# Altium schematic sheet Stara wersja zasilania.SchDoc (part 2 of 3)
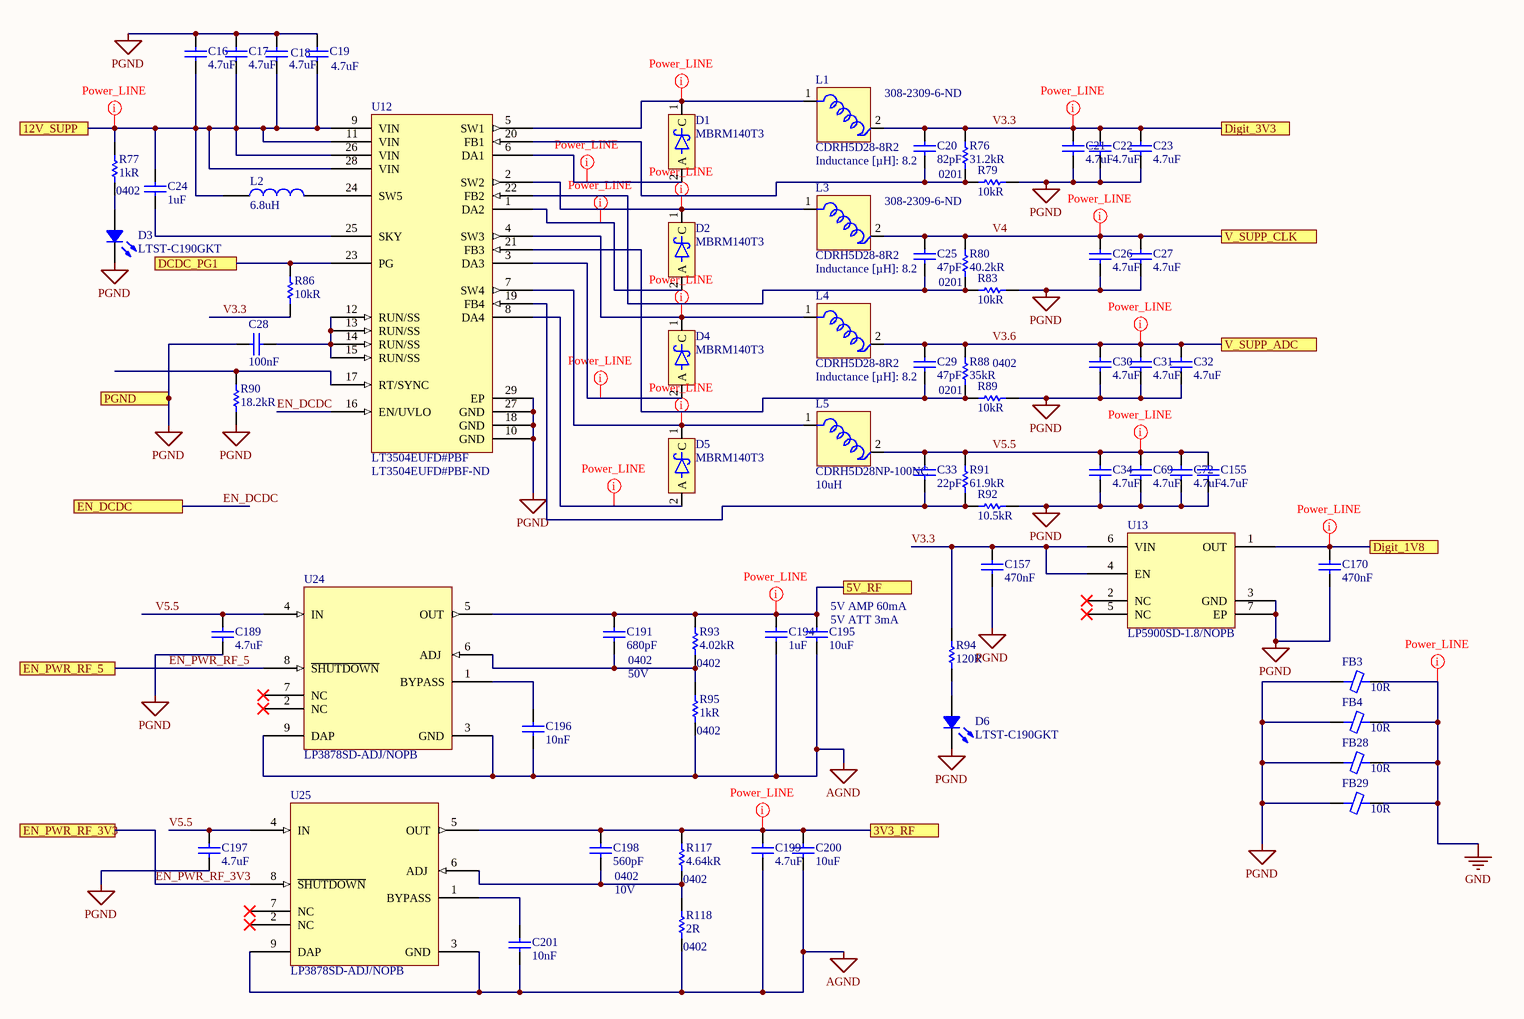
[diagram p1: Stara wersja zasilania.SchDoc]
## Library data of the parts
C16-C19 = Capacitor: Manufacturer 1: Samsung; Manufacturer Part Number 1: CL10A475KO8NNNC; Material: Ceramic; Tolerance: 10%; Voltage Rating: 16V; Dielectric: X5R; Supplier 1: Digi-Key; Supplier Part Number 1: 1276-1784-1-ND; Stock 1: 468811; Pricing 1: 1=0.26000, 10=0.17800, 100=0.10100, 500=0.07128, 1000=0.06237 (USD); RoHS: Yes; Mount: Surface Mount; Case/Package: 0603; Case Code (Metric): 1608; Case Code (Imperial): 0603; Contact Plating: Tin; Min Operating Temperature: -55°C; Max Operating Temperature: 85°C; Packaging: Tape and Reel; Package Quantity: 1; Capacitance: 4.7uF; Voltage: 16V; Length: 1.6mm; Height: 0.8mm; Width: 0.031inch; Thickness: 0.035inch; Depth: 0.8mm; Radiation Hardening: No; ComponentLink1URL: https://datasheet.ciiva.com/25795/cl10a475ko8nnnc-25795890.pdf?src-supplier=Digi-Key; ComponentLink1Description: https://datasheet.ciiva.com/25795/cl10a475ko8nnnc-25795890.pdf?src-supplier=Digi-Key; ComponentLink2URL: https://datasheet.ciiva.com/26838/getdatasheetpartid-358619-26838383.pdf?src-supplier=Verical; ComponentLink2Description: https://datasheet.ciiva.com/26838/getdatasheetpartid-358619-26838383.pdf?src-supplier=Verical; ComponentLink3URL: https://datasheet.ciiva.com/29198/457663-da-01-en-vs-kondensator-0603-29198671.pdf?src-supplier=Conrad; ComponentLink3Description: https://datasheet.ciiva.com/29198/457663-da-01-en-vs-kondensator-0603-29198671.pdf?src-supplier=Conrad
C20 = Capacitor: Multilayer Ceramic Capacitors MLCC - SMD/SMT 0201 82pF 25volts C0G +/-5%; Manufacturer: Murata; Manufacturer Part Number: GRM0335C1E820JA01D; Tolerance: 5%; Voltage Rating: 25V; Supplier 1: Digi-Key; Supplier Part Number 1: 490-11303-1-ND; RoHS: Yes; Category: Ceramic Capacitors; Stock 1: 229104; Pricing 1: 1=0,10000, 10=0,01700, 100=0,00740, 500=0,00532, 1000=0,00417, 2500=0,00380, 5000=0,00349 (USD); Mount: Surface Mount; Case Code (Imperial): 0201; Case Code (Metric): 0603; Min Operating Temperature: -55°C; Max Operating Temperature: 125°C; Dielectric: C0G; Termination: SMD/SMT; Capacitance: 82pF; Voltage Rating (DC): 25V; Packaging: Tape and Reel; Package Quantity: 15000; Length: 0.024inch; Height: 0.3mm; Thickness: 0.013inch; Width: 0.012inch; Lead Free: Lead Free; ComponentLink1URL: https://datasheet.ciiva.com/29538/grm0335c1e820ja01-01-29538864.pdf?src-supplier=Digi-Key; ComponentLink1Description: https://datasheet.ciiva.com/29538/grm0335c1e820ja01-01-29538864.pdf?src-supplier=Digi-Key
C21-C23 C26 C27 C30-C32 C199 = Capacitor: Manufacturer 1: Samsung; Manufacturer Part Number 1: CL10A475KQ8NNNC; Material: Ceramic; Tolerance: 20%; Voltage Rating: 6.3V; Dielectric: X5R; Supplier 1: Digi-Key; Supplier Part Number 1: 1276-1045-1-ND; Stock 1: 3419762; Pricing 1: 1=0.10000, 10=0.05500, 100=0.02450, 500=0.01750, 1000=0.01375 (USD); RoHS: Yes; Mount: Surface Mount; Case/Package: 0603; Case Code (Metric): 1608; Case Code (Imperial): 0603; Contact Plating: Tin; Min Operating Temperature: -55°C; Max Operating Temperature: 85°C; Capacitance: 4.7uF; Packaging: Tape and Reel; Package Quantity: 1; Voltage: 6.3V; Length: 1.6mm; Height: 0.8mm; Width: 0.031inch; Thickness: 0.035inch; Depth: 0.8mm; Radiation Hardening: No; ComponentLink1URL: https://datasheet.ciiva.com/15195/getdatasheetpartid-358620-15195714.pdf?src-supplier=Verical; ComponentLink1Description: https://datasheet.ciiva.com/15195/getdatasheetpartid-358620-15195714.pdf?src-supplier=Verical; ComponentLink2URL: https://datasheet.ciiva.com/29198/457675-da-01-en-vs-kondensator-0603-29198672.pdf?src-supplier=Conrad; ComponentLink2Description: https://datasheet.ciiva.com/29198/457675-da-01-en-vs-kondensator-0603-29198672.pdf?src-supplier=Conrad; ComponentLink3URL: https://datasheet.ciiva.com/16437/cl05b104kq5nnnc-16437321.pdf?src-supplier=Future+Electronics; ComponentLink3Description: https://datasheet.ciiva.com/16437/cl05b104kq5nnnc-16437321.pdf?src-supplier=Future+Electronics
C24 = Capacitor: Manufacturer 1: Samsung; Manufacturer Part Number 1: CL05A105MQ5NNNC; Tolerance: 20%; Voltage Rating: 6.3V; Dielectric: X5R; Supplier 1: Digi-Key; Supplier Part Number 1: 1276-1235-1-ND; Stock 1: 4412453; Pricing 1: 1=0.10000, 10=0.02600, 100=0.01160, 500=0.00832, 1000=0.00653, 2500=0.00594, 5000=0.00546 (USD); RoHS: Yes; Mount: Surface Mount; Case/Package: 0402; Case Code (Metric): 1005; Case Code (Imperial): 0402; Contact Plating: Tin; Min Operating Temperature: -55°C; Max Operating Temperature: 85°C; Package Quantity: 1; Packaging: Tape and Reel; Capacitance: 1uF; Length: 1mm; Height: 0.5mm; Width: 0.02inch; Thickness: 0.022inch; Depth: 0.5mm; Radiation Hardening: No; ComponentLink1URL: https://datasheet.ciiva.com/25802/cl05a105mq5nnnc-25802787.pdf?src-supplier=Digi-Key; ComponentLink1Description: https://datasheet.ciiva.com/25802/cl05a105mq5nnnc-25802787.pdf?src-supplier=Digi-Key; ComponentLink2URL: https://datasheet.ciiva.com/26838/getdatasheetpartid-355273-26838165.pdf?src-supplier=Verical; ComponentLink2Description: https://datasheet.ciiva.com/26838/getdatasheetpartid-355273-26838165.pdf?src-supplier=Verical; ComponentLink3URL: https://datasheet.ciiva.com/16387/cl05b104kq5nnnc-16387465.pdf?src-supplier=Future+Electronics; ComponentLink3Description: https://datasheet.ciiva.com/16387/cl05b104kq5nnnc-16387465.pdf?src-supplier=Future+Electronics
C25 C29 = Capacitor: CAP CER 47PF 25V 5% NP0 0201; Manufacturer: Murata; Manufacturer Part Number: GRM0335C1E470JA01J; Supplier 1: Digi-Key; Supplier Part Number 1: 490-14548-1-ND; RoHS: Yes; Category: Ceramic Capacitors; Stock 1: 86315; Pricing 1: 1=0,10000, 10=0,01300, 100=0,00560, 500=0,00400, 1000=0,00315, 2500=0,00286, 5000=0,00263 (USD); Mount: Surface Mount; Case Code (Imperial): 0201; Case Code (Metric): 0603; Min Operating Temperature: -55°C; Max Operating Temperature: 125°C; Voltage Rating (DC): 25V; Termination: SMD/SMT; Capacitance: 47pF; Tolerance: 5%; Packaging: Tape and Reel; Voltage Rating: 25V; Package Quantity: 50000; Length: 0.024inch; Thickness: 0.013inch; Width: 0.012inch; Lead Free: Lead Free; ComponentLink1URL: https://datasheet.ciiva.com/29535/grm0335c1e470ja01-01-29535197.pdf?src-supplier=Digi-Key; ComponentLink1Description: https://datasheet.ciiva.com/29535/grm0335c1e470ja01-01-29535197.pdf?src-supplier=Digi-Key
C28 = Capacitor: Manufacturer 1: Samsung; Manufacturer Part Number 1: CL10B104KB8NNNC; Material: Ceramic; Tolerance: 10%; Dielectric: X7R; Voltage Rating: 50V; Supplier 1: Digi-Key; Supplier Part Number 1: 1276-1000-1-ND; Stock 1: 8464769; Pricing 1: 1=0.10000, 10=0.02600, 100=0.01170, 500=0.00836, 1000=0.00657 (USD); RoHS: Yes; Mount: Surface Mount; Case/Package: 0603; Case Code (Metric): 1608; Case Code (Imperial): 0603; Contact Plating: Tin; Min Operating Temperature: -55°C; Max Operating Temperature: 125°C; Package Quantity: 1; Packaging: Tape and Reel; Capacitance: 100nF; Voltage: 50V; Voltage Rating (DC): 50V; Length: 1.6mm; Height: 0.8mm; Width: 0.031inch; Depth: 0.8mm; Thickness: 0.035inch; Radiation Hardening: No; Lead Free: Lead Free; ComponentLink1URL: https://datasheet.ciiva.com/25803/cl10b104kb8nnnc-25803393.pdf?src-supplier=Digi-Key; ComponentLink1Description: https://datasheet.ciiva.com/25803/cl10b104kb8nnnc-25803393.pdf?src-supplier=Digi-Key; ComponentLink2URL: https://datasheet.ciiva.com/26838/getdatasheetpartid-89097-26838411.pdf?src-supplier=Verical; ComponentLink2Description: https://datasheet.ciiva.com/26838/getdatasheetpartid-89097-26838411.pdf?src-supplier=Verical; ComponentLink3URL: https://datasheet.ciiva.com/29198/456651-da-01-en-vs-kondensator-0605-29198839.pdf?src-supplier=Conrad; ComponentLink3Description: https://datasheet.ciiva.com/29198/456651-da-01-en-vs-kondensator-0605-29198839.pdf?src-supplier=Conrad
C33 = Capacitor: Manufacturer 1: Samsung; Manufacturer Part Number 1: CL05C220JB5NNNC; Material: Ceramic; Tolerance: 5%; Voltage Rating: 50V; Dielectric: C0G; Temperature Coefficient: 300ppm/°C; Supplier 1: Digi-Key; Supplier Part Number 1: 1276-1116-1-ND; Stock 1: 1523204; Pricing 1: 1=0.10000, 10=0.03300, 100=0.01480, 500=0.01058, 1000=0.00831, 2500=0.00755, 5000=0.00695 (USD); RoHS: Yes; Mount: Surface Mount; Case/Package: 0402; Case Code (Metric): 1005; Case Code (Imperial): 0402; Contact Plating: Tin; Min Operating Temperature: -55°C; Max Operating Temperature: 125°C; Package Quantity: 1; Packaging: Tape and Reel; Capacitance: 22pF; Voltage: 50V; Length: 1mm; Height: 0.5mm; Width: 0.02inch; Thickness: 0.022inch; Depth: 0.5mm; Radiation Hardening: No; ComponentLink1URL: https://datasheet.ciiva.com/15195/getdatasheetpartid-358448-15195679.pdf?src-supplier=Verical; ComponentLink1Description: https://datasheet.ciiva.com/15195/getdatasheetpartid-358448-15195679.pdf?src-supplier=Verical; ComponentLink2URL: https://datasheet.ciiva.com/29198/458663-da-01-en-vs-kondensator-0402-29198414.pdf?src-supplier=Conrad; ComponentLink2Description: https://datasheet.ciiva.com/29198/458663-da-01-en-vs-kondensator-0402-29198414.pdf?src-supplier=Conrad; ComponentLink3URL: https://datasheet.ciiva.com/16199/cl05b104kq5nnnc-16199080.pdf?src-supplier=Future+Electronics; ComponentLink3Description: https://datasheet.ciiva.com/16199/cl05b104kq5nnnc-16199080.pdf?src-supplier=Future+Electronics; ComponentLink4URL: https://datasheet.ciiva.com/26309/mlcc-catalogdownload2013-eng-26309032.pdf?src-supplier=Distrelec; ComponentLink4Description: https://datasheet.ciiva.com/26309/mlcc-catalogdownload2013-eng-26309032.pdf?src-supplier=Distrelec
C34 C69 C72 C155 C189 C197 = Capacitor: Cap Ceramic 4.7uF 10V X5R 10% SMD 0603 85C T/R; Manufacturer: Taiyo Yuden; Manufacturer Part Number: LMK107BJ475KA-T; Supplier 1: Digi-Key; Supplier Part Number 1: 587-1441-1-ND; RoHS: Yes; Category: Ceramic Capacitors; Stock 1: 2822727; Pricing 1: 1=0,19000, 10=0,12700, 100=0,06440, 500=0,04408, 1000=0,03899 (USD); Mount: Surface Mount; Case/Package: 0603; Number of Pins: 2; Dielectric Material: Ceramic; Contact Plating: Nickel; Case Code (Imperial): 0603; Case Code (Metric): 1608; Min Operating Temperature: -55°C; Max Operating Temperature: 85°C; Dielectric: X5R; Voltage Rating (DC): 10V; Capacitance: 4.7uF; Tolerance: 10%; Packaging: Tape and Reel; Package Quantity: 1; Termination: SMD/SMT; Voltage Rating: 10V; Length: 1.6mm; Height: 0.8mm; Width: 0.031inch; Thickness: 0.035inch; Depth: 0.8mm; Radiation Hardening: No; Lead Free: Lead Free; Halogen Free: Halogen Free; REACH SVHC: Unknown; ComponentLink1URL: https://datasheet.ciiva.com/135/lmk107bj475ka-t-ss-135643.pdf?src-supplier=Digi-Key; ComponentLink1Description: https://datasheet.ciiva.com/135/lmk107bj475ka-t-ss-135643.pdf?src-supplier=Digi-Key; ComponentLink2URL: https://datasheet.ciiva.com/26872/getdatasheetpartid-638615-26872655.pdf?src-supplier=Verical; ComponentLink2Description: https://datasheet.ciiva.com/26872/getdatasheetpartid-638615-26872655.pdf?src-supplier=Verical; ComponentLink3URL: https://datasheet.ciiva.com/15921/344lmk107bj475ka-t-15921264.pdf?src-supplier=Onlinecomponents.com; ComponentLink3Description: https://datasheet.ciiva.com/15921/344lmk107bj475ka-t-15921264.pdf?src-supplier=Onlinecomponents.com; ComponentLink4URL: https://datasheet.ciiva.com/30054/131lmk107bj475ka-t-30054339.pdf?src-supplier=Onlinecomponents.com; ComponentLink4Description: https://datasheet.ciiva.com/30054/131lmk107bj475ka-t-30054339.pdf?src-supplier=Onlinecomponents.com; ComponentLink5URL: https://datasheet.ciiva.com/11463/lmk107bj475ka-t-ss-11463768.pdf?src-supplier=Avnet; ComponentLink5Description: https://datasheet.ciiva.com/11463/lmk107bj475ka-t-ss-11463768.pdf?src-supplier=Avnet; ComponentLink6URL: https://datasheet.ciiva.com/5424/mlcc01-e-5424565.pdf?src-supplier=Mouser; ComponentLink6Description: https://datasheet.ciiva.com/5424/mlcc01-e-5424565.pdf?src-supplier=Mouser; ComponentLink7URL: https://datasheet.ciiva.com/7975/746258-7975564.pdf?src-supplier=Element14; ComponentLink7Description: https://datasheet.ciiva.com/7975/746258-7975564.pdf?src-supplier=Element14
C157 C170 = Capacitor: Manufacturer 1: Samsung; Manufacturer Part Number 1: CL05A474KP5NNNC; Tolerance: 10%; Voltage Rating: 10V; Dielectric: X5R; Supplier 1: Digi-Key; Supplier Part Number 1: 1276-1173-1-ND; Stock 1: 1267992; Pricing 1: 1=0.10000, 10=0.07000, 100=0.03140, 500=0.02240, 1000=0.01761, 2500=0.01600, 5000=0.01472 (USD); RoHS: Yes; Mount: Surface Mount; Case/Package: 0402; Case Code (Metric): 1005; Case Code (Imperial): 0402; Min Operating Temperature: -55°C; Max Operating Temperature: 85°C; Packaging: Tape and Reel; Capacitance: 470nF; Voltage Rating (DC): 10V; Length: 1mm; Height: 0.5mm; Width: 0.02inch; Thickness: 0.022inch; Depth: 0.5mm; Radiation Hardening: No; Lead Free: Lead Free; ComponentLink1URL: https://datasheet.ciiva.com/25710/cl05a474kp5nnnc-25710324.pdf?src-supplier=Digi-Key; ComponentLink1Description: https://datasheet.ciiva.com/25710/cl05a474kp5nnnc-25710324.pdf?src-supplier=Digi-Key; ComponentLink2URL: https://datasheet.ciiva.com/26838/getdatasheetpartid-355286-26838191.pdf?src-supplier=Verical; ComponentLink2Description: https://datasheet.ciiva.com/26838/getdatasheetpartid-355286-26838191.pdf?src-supplier=Verical; ComponentLink3URL: https://datasheet.ciiva.com/16437/cl05b104kq5nnnc-16437351.pdf?src-supplier=Future+Electronics; ComponentLink3Description: https://datasheet.ciiva.com/16437/cl05b104kq5nnnc-16437351.pdf?src-supplier=Future+Electronics
C191 = Capacitor: Manufacturer 1: Samsung; Manufacturer Part Number 1: CL05B681KB5NNNC; Material: Ceramic; Tolerance: 10%; Dielectric: X7R; Supplier 1: Digi-Key; Supplier Part Number 1: 1276-1583-1-ND; Stock 1: 1154024; Pricing 1: 1=0.10000, 10=0.03200, 100=0.01420, 500=0.01012, 1000=0.00795, 2500=0.00722, 5000=0.00665 (USD); RoHS: Yes; Mount: Surface Mount; Case Code (Metric): 1005; Case Code (Imperial): 0402; Min Operating Temperature: -55°C; Max Operating Temperature: 125°C; Package Quantity: 1; Packaging: Tape and Reel; Capacitance: 680pF; Length: 1mm; Height: 0.5mm; Width: 0.02inch; Thickness: 0.022inch; Depth: 0.5mm; Radiation Hardening: No; ComponentLink1URL: https://datasheet.ciiva.com/16428/cl05b681kb5nnnc-16428786.pdf?src-supplier=Future+Electronics; ComponentLink1Description: https://datasheet.ciiva.com/16428/cl05b681kb5nnnc-16428786.pdf?src-supplier=Future+Electronics; ComponentLink2URL: https://datasheet.ciiva.com/25789/cl05b681kb5nnnc-25789493.pdf?src-supplier=Digi-Key; ComponentLink2Description: https://datasheet.ciiva.com/25789/cl05b681kb5nnnc-25789493.pdf?src-supplier=Digi-Key; ComponentLink3URL: https://datasheet.ciiva.com/29198/458344-da-01-en-vs-kondensator-0402-29198504.pdf?src-supplier=Conrad; ComponentLink3Description: https://datasheet.ciiva.com/29198/458344-da-01-en-vs-kondensator-0402-29198504.pdf?src-supplier=Conrad
C194 = Capacitor: Manufacturer 1: TDK; Manufacturer Part Number 1: C1608X7R1C105K080AC; Dielectric Material: Ceramic; Tolerance: 10%; Voltage Rating: 16V; Dielectric: X7R; Supplier 1: Digi-Key; Supplier Part Number 1: 445-1604-1-ND; Stock 1: 314791; Pricing 1: 1=0.15000, 10=0.10500, 100=0.04950, 500=0.03472, 1000=0.02875 (USD); RoHS: Yes; Mount: Surface Mount; Case/Package: 0603; Weight: 7.1E-05oz; Case Code (Metric): 1608; Case Code (Imperial): 0603; Min Operating Temperature: -55°C; Max Operating Temperature: 125°C; Packaging: Tape and Reel; Package Quantity: 1; Termination: SMD/SMT; Capacitance: 1uF; Voltage Rating (DC): 16V; Composition: Ceramic; Voltage: 16V; Length: 1.6mm; Height: 0.8mm; Width: 0.031inch; Thickness: 0.037inch; Depth: 0.8mm; Radiation Hardening: No; REACH SVHC: No SVHC; Lead Free: Lead Free; ComponentLink1URL: https://datasheet.ciiva.com/22648/1796654-22648704.pdf?src-supplier=Element14; ComponentLink1Description: https://datasheet.ciiva.com/22648/1796654-22648704.pdf?src-supplier=Element14; ComponentLink2URL: https://datasheet.ciiva.com/11788/0900766b80c1bb00-11788075.pdf?src-supplier=RSComponents; ComponentLink2Description: https://datasheet.ciiva.com/11788/0900766b80c1bb00-11788075.pdf?src-supplier=RSComponents; ComponentLink3URL: https://datasheet.ciiva.com/6250/tdkmlcccaprange-6250871.pdf?src-supplier=Digi-Key; ComponentLink3Description: https://datasheet.ciiva.com/6250/tdkmlcccaprange-6250871.pdf?src-supplier=Digi-Key; ComponentLink4URL: https://datasheet.ciiva.com/16199/e412-c-16199815.pdf?src-supplier=Future+Electronics; ComponentLink4Description: https://datasheet.ciiva.com/16199/e412-c-16199815.pdf?src-supplier=Future+Electronics; ComponentLink5URL: https://datasheet.ciiva.com/6156/1571323-6156168.pdf?src-supplier=Farnell; ComponentLink5Description: https://datasheet.ciiva.com/6156/1571323-6156168.pdf?src-supplier=Farnell; ComponentLink6URL: https://datasheet.ciiva.com/48671/e412-c-48671305.pdf?src-supplier=Avnet; ComponentLink6Description: https://datasheet.ciiva.com/48671/e412-c-48671305.pdf?src-supplier=Avnet; ComponentLink7URL: https://datasheet.ciiva.com/26285/3025c1608x7r1c105k080ac-26285242.pdf?src-supplier=Onlinecomponents.com; ComponentLink7Description: https://datasheet.ciiva.com/26285/3025c1608x7r1c105k080ac-26285242.pdf?src-supplier=Onlinecomponents.com; ComponentLink8URL: https://datasheet.ciiva.com/22749/1744655-22749595.pdf?src-supplier=Element14; ComponentLink8Description: https://datasheet.ciiva.com/22749/1744655-22749595.pdf?src-supplier=Element14; ComponentLink9URL: https://datasheet.ciiva.com/15192/getdatasheetpartid-715881-15192029.pdf?src-supplier=Verical; ComponentLink9Description: https://datasheet.ciiva.com/15192/getdatasheetpartid-715881-15192029.pdf?src-supplier=Verical; ComponentLink10URL: https://datasheet.ciiva.com/17487/e412-c-17487343.pdf?src-supplier=Avnet+Europe; ComponentLink10Description: https://datasheet.ciiva.com/17487/e412-c-17487343.pdf?src-supplier=Avnet+Europe; ComponentLink11URL: https://datasheet.ciiva.com/22694/1796654-22694127.pdf?src-supplier=Element14; ComponentLink11Description: https://datasheet.ciiva.com/22694/1796654-22694127.pdf?src-supplier=Element14
C195 C200 = Capacitor: Manufacturer 1: KEMET; Manufacturer Part Number 1: C0805C106K8PACTU; Dielectric Material: Ceramic; Tolerance: 10%; Dielectric: X5R; Voltage Rating (DC): 10V; Supplier 1: Digi-Key; Supplier Part Number 1: 399-4925-1-ND; Stock 1: 697277; Pricing 1: 1=0.16000, 10=0.11700, 100=0.05500, 500=0.03858, 1000=0.03194 (USD); RoHS: Yes; Mount: Surface Mount; Case/Package: 0805; Number of Pins: 2; Contact Plating: Tin,Matte; Case Code (Imperial): 0805; Case Code (Metric): 2012; Min Operating Temperature: -55°C; Max Operating Temperature: 85°C; Capacitance: 10uF; Packaging: Tape and Reel; Termination: SMD/SMT; Package Quantity: 1; Voltage Rating: 10V; Voltage: 10V; Dissipation Factor: 10%; Length: 2mm; Height: 1.25mm; Depth: 1.25mm; Width: 1.2mm; Thickness: 0.055inch; Radiation Hardening: No; REACH SVHC: No SVHC; ComponentLink1URL: https://datasheet.ciiva.com/7842/1732709-7842198.pdf?src-supplier=Element14; ComponentLink1Description: https://datasheet.ciiva.com/7842/1732709-7842198.pdf?src-supplier=Element14; ComponentLink2URL: https://datasheet.ciiva.com/22704/1732709-22704859.pdf?src-supplier=Element14; ComponentLink2Description: https://datasheet.ciiva.com/22704/1732709-22704859.pdf?src-supplier=Element14
C196 C201 = Capacitor: Manufacturer 1: Murata; Manufacturer Part Number 1: GRM1885C1H103JA01D; Material: Ceramic; Voltage Rating: 50V; Tolerance: 5%; Dielectric: C0G; Supplier 1: Digi-Key; Supplier Part Number 1: 490-9666-1-ND; Stock 1: 1084376; Pricing 1: 1=0.20000, 10=0.13500, 100=0.06820, 500=0.04664, 1000=0.04126 (USD); RoHS: Yes; Mount: Surface Mount; Case/Package: 0603; Case Code (Metric): 1608; Case Code (Imperial): 0603; Min Operating Temperature: -55°C; Max Operating Temperature: 125°C; Packaging: Tape and Reel; Package Quantity: 4000; Capacitance: 10nF; Voltage Rating (DC): 50V; Termination: SMD/SMT; Voltage: 50V; Length: 1.6mm; Height: 0.8mm; Width: 0.8mm; Thickness: 0.035inch; Lead Pitch: 0.5mm; Depth: 0.8mm; REACH SVHC: No SVHC; Lead Free: Lead Free; ComponentLink1URL: https://datasheet.ciiva.com/29537/partnumbering-e-01-29537910.pdf?src-supplier=Digi-Key; ComponentLink1Description: https://datasheet.ciiva.com/29537/partnumbering-e-01-29537910.pdf?src-supplier=Digi-Key; ComponentLink2URL: https://datasheet.ciiva.com/41860/partnumbering-e-01-41860759.pdf?src-supplier=Digi-Key; ComponentLink2Description: https://datasheet.ciiva.com/41860/partnumbering-e-01-41860759.pdf?src-supplier=Digi-Key
C198 = Capacitor: CAP CER 560PF 10V X7R 0402; Manufacturer: Kyocera AVX; Manufacturer Part Number: 0402ZC561KAT2A; Tolerance: 10%; Supplier 1: Digi-Key; Supplier Part Number 1: 478-11791-1-ND; RoHS: Yes; Category: Ceramic Capacitors; Stock 1: 5031; Pricing 1: 1=0,33000, 10=0,22800, 100=0,12900, 500=0,09108, 1000=0,07970, 2500=0,07590, 5000=0,07021 (USD); Mount: Surface Mount; Case Code (Imperial): 0402; Case Code (Metric): 1005; Min Operating Temperature: -55°C; Max Operating Temperature: 125°C; Capacitance: 560pF; Package Quantity: 10000; Voltage Rating (DC): 10V; Packaging: Tape and Reel; Termination: SMD/SMT; Dielectric: X7R; Length: 1mm; Width: 0.5mm; Thickness: 0.022inch; Depth: 0.5mm; Radiation Hardening: No; Lead Free: Lead Free; ComponentLink1URL: https://datasheet.ciiva.com/6269/cx7r-6269704.pdf?src-supplier=Digi-Key; ComponentLink1Description: https://datasheet.ciiva.com/6269/cx7r-6269704.pdf?src-supplier=Digi-Key
D1 D2 D4 D5 = MBRM140T1G: Supplier Part Number 1: MBRM140T3GOSCT-ND; Supplier 1: Digi-Key
D3 D6 = LTST-C190GKT: LED,  LTST-C190GKT; Manufacturer 1: Vishay Lite-On; Color: Green; Lens Color: Colorless; Luminous Intensity: 6mcd; Forward Voltage: 2.1V; Viewing Angle: 130°; Lens Style: Clear,Diffused,Colorless,Rectangular; Forward Current: 30mA; Power Rating: 100mW; Dominant Wavelength: 569nm; Test Current: 10mA; Lens Transparency: Clear; Number of Elements: 1; Wavelength: 565nm; Voltage: 2V; Reverse Voltage: 5V; Supplier 1: Digi-Key; Manufacturer Part Number 1: LTST-C190GKT; Stock 1: 908158; Pricing 1: 1=0.26000, 10=0.18800, 100=0.08880, 500=0.05922, 1000=0.04639 (USD); RoHS: Yes; Mount: Surface Mount; Case/Package: 0603; Number of Pins: 2; Case Code (Metric): 1608; Case Code (Imperial): 0603; Min Operating Temperature: -55°C; Max Operating Temperature: 85°C; Package Quantity: 1; Packaging: Tape and Reel; Illumination Color: Green; Power Dissipation: 100mW; Number of LEDs: 1; Length: 1.6mm; Height: 0.8mm; Width: 0.8mm; Depth: 0.8mm; Radiation Hardening: No; Lead Free: Lead Free; ComponentLink1URL: https://datasheet.ciiva.com/11775/0900766b80dc02a6-11775616.pdf?src-supplier=RSComponents; ComponentLink1Description: https://datasheet.ciiva.com/11775/0900766b80dc02a6-11775616.pdf?src-supplier=RSComponents; ComponentLink2URL: https://datasheet.ciiva.com/2109/ltst-c190gkt-2109985.pdf?src-supplier=Digi-Key; ComponentLink2Description: https://datasheet.ciiva.com/2109/ltst-c190gkt-2109985.pdf?src-supplier=Digi-Key; ComponentLink3URL: https://datasheet.ciiva.com/16392/lite-on20ltst-c190gkt-16392818.pdf?src-supplier=Future+Electronics; ComponentLink3Description: https://datasheet.ciiva.com/16392/lite-on20ltst-c190gkt-16392818.pdf?src-supplier=Future+Electronics; ComponentLink4URL: https://datasheet.ciiva.com/12403/lite-on-ltst-c190gkt-187204-12403884.pdf?src-supplier=Mouser; ComponentLink4Description: https://datasheet.ciiva.com/12403/lite-on-ltst-c190gkt-187204-12403884.pdf?src-supplier=Mouser; ComponentLink5URL: https://datasheet.ciiva.com/2109/ltst-c190gkt-2109986.pdf?src-supplier=Digi-Key; ComponentLink5Description: https://datasheet.ciiva.com/2109/ltst-c190gkt-2109986.pdf?src-supplier=Digi-Key; ComponentLink6URL: https://datasheet.ciiva.com/2109/ltst-c190gkt-2109987.pdf?src-supplier=Digi-Key; ComponentLink6Description: https://datasheet.ciiva.com/2109/ltst-c190gkt-2109987.pdf?src-supplier=Digi-Key; Supplier Part Number 1: 160-1183-1-ND
FB3 FB4 FB28 FB29 = Ferrite: Manufacturer 1: Murata; Manufacturer Part Number 1: BLM15AX100SN1D; Material: Ferrite,Steel; Tolerance: 25%; Current Rating: 1.74A; Number of Lines: 1; DC Resistance (DCR): 15mR; Test Frequency: 100MHz; Supplier 1: Digi-Key; Supplier Part Number 1: 490-5437-1-ND; Stock 1: 154406; Pricing 1: 1=0.11000, 10=0.09000, 25=0.08120, 50=0.05960, 100=0.05140, 250=0.04060, 500=0.03428, 1000=0.02886, 5000=0.02571 (USD); RoHS: Yes; Case/Package: 0402; Number of Pins: 2; Case Code (Metric): 1005; Case Code (Imperial): 0402; Min Operating Temperature: -55°C; Max Operating Temperature: 125°C; Package Quantity: 1; Packaging: Tape and Reel; Impedance: 10R; Max Current Rating: 1.74A; Max DC Current: 1.74A; Termination: SMD/SMT; Number of Circuits: 1; Length: 1mm; Height: 0.5mm; Width: 0.5mm; Depth: 0.5mm; REACH SVHC: No SVHC; Lead Free: Lead Free; ComponentLink1URL: https://datasheet.ciiva.com/41449/001172165-da-01-en-drossel-0402-10r0-1-0x0-5mm-10000st-41449453.pdf?src-supplier=Conrad; ComponentLink1Description: https://datasheet.ciiva.com/41449/001172165-da-01-en-drossel-0402-10r0-1-0x0-5mm-10000st-41449453.pdf?src-supplier=Conrad; ComponentLink2URL: https://datasheet.ciiva.com/1012/l0110e-1012384.pdf?src-supplier=Digi-Key; ComponentLink2Description: https://datasheet.ciiva.com/1012/l0110e-1012384.pdf?src-supplier=Digi-Key; ComponentLink3URL: https://datasheet.ciiva.com/1012/l0110e-1012385.pdf?src-supplier=Digi-Key; ComponentLink3Description: https://datasheet.ciiva.com/1012/l0110e-1012385.pdf?src-supplier=Digi-Key; ComponentLink4URL: https://datasheet.ciiva.com/1012/l0110e-1012383.pdf?src-supplier=Digi-Key; ComponentLink4Description: https://datasheet.ciiva.com/1012/l0110e-1012383.pdf?src-supplier=Digi-Key
L1 L3 L4 = CDRH5D28-8R2: Part Number: CDRH5D28NP-8R2; Supplier 2: Digi-Key
  L4: Supplier Part Number 2: 308-2309-6-ND
L2 = Inductor: Fixed Inductors 6.8uH; Manufacturer: TDK; Manufacturer Part Number: GLFR1608T6R8M-LR; DC Resistance (DCR): 350mR; Max DC Current: 400mA; Test Frequency: 7.96MHz; Current Rating: 135mA; Tolerance: 20%; Shielding: Shielded; Supplier 1: Digi-Key; Supplier Part Number 1: 445-6156-1-ND; RoHS: Yes; Category: Fixed Inductors; Stock 1: 6812; Pricing 1: 1=0,27000, 10=0,24400, 100=0,16760, 500=0,14324, 1000=0,10971 (USD); Mount: Surface Mount; Case/Package: 0603; Case Code (Metric): 1608; Case Code (Imperial): 0603; Min Operating Temperature: -40°C; Max Operating Temperature: 105°C; Inductance: 6.8uH; Termination: SMD/SMT; DC Current: 400mA; Military Standard: Not; Package Quantity: 4000; Saturation Current: 135mA; Packaging: Tape and Reel; Length: 0.063inch; Height: 0.031inch; Depth: 1mm; Width: 0.031inch; Lead Free: Lead Free; ComponentLink1URL: https://datasheet.ciiva.com/1040/glfrseries-1040833.pdf?src-supplier=Digi-Key; ComponentLink1Description: https://datasheet.ciiva.com/1040/glfrseries-1040833.pdf?src-supplier=Digi-Key; ComponentLink2URL: https://datasheet.ciiva.com/1040/glfrseries-1040834.pdf?src-supplier=Digi-Key; ComponentLink2Description: https://datasheet.ciiva.com/1040/glfrseries-1040834.pdf?src-supplier=Digi-Key; ComponentLink3URL: https://datasheet.ciiva.com/1040/glfrseries-1040835.pdf?src-supplier=Digi-Key; ComponentLink3Description: https://datasheet.ciiva.com/1040/glfrseries-1040835.pdf?src-supplier=Digi-Key
L5 = CDRH5D28NP-100NC: Inductor Power Shielded Drum Core 10uH 30% 100KHz Ferrite 1.3A 65mOhm DCR T/R; Manufacturer: Sumida; DC Resistance (DCR): 65mR; Supplier 1: Mouser; Manufacturer Part Number: CDRH5D28NP-100NC; RoHS: Yes; Category: Fixed Inductors; Stock 1: 3724; Pricing 1: 1=0,68000, 10=0,52000, 100=0,40200, 1000=0,28900, 2000=0,26300, 10000=0,25500, 24000=0,24600, 50000=0,23800, 100000=0,22600 (USD); Mount: Surface Mount; Case/Package: Nonstandard; Core Material: Ferrite; Min Operating Temperature: -40°C; Max Operating Temperature: 100°C; Tolerance: 30%; Shielding: Shielded; Packaging: Tape and Reel; Package Quantity: 1; Current Rating: 1.3A; Max DC Current: 1.3A; Termination: SMD/SMT; Test Frequency: 100kHz; DC Current: 1.3A; Military Standard: Not; Length: 6mm; Height: 3mm; Width: 6mm; Height - Seated (Max): 0.118inch; Depth: 6mm; Radiation Hardening: No; Lead Free: Lead Free; ComponentLink1URL: https://datasheet.ciiva.com/26793/cdrh5d28np-100nc-26793522.pdf?src-supplier=IIIC; ComponentLink1Description: https://datasheet.ciiva.com/26793/cdrh5d28np-100nc-26793522.pdf?src-supplier=IIIC; Supplier Part Number 1: 851-CDRH5D28NP-100NC
R76 = Resistor: Thin Film Resistors 31.2kOhm,0402,0.5%,2 5ppm,63mW,50V; Manufacturer: KOA Speer; Manufacturer Part Number: RN73H1ETTP3122D25; Temperature Coefficient: 25ppm/°C; Supplier 1: Digi-Key; Supplier Part Number 1: 2019-RN73H1ETTP3122D25CT-ND; RoHS: No; Category: Resistors; Stock 1: 14565; Pricing 1: 1=0,49000, 10=0,37200, 100=0,15630, 1000=0,08624, 2500=0,08085, 5000=0,07330 (USD); Case/Package: 0402; Weight: 2.3E-05oz; Case Code (Imperial): 0402; Case Code (Metric): 1005; Min Operating Temperature: -55°C; Max Operating Temperature: 155°C; Termination: SMD/SMT; Composition: Metal Film; Voltage Rating (DC): 50V; Resistance: 31.2kR; Power Rating: 63mW; Packaging: Tape and Reel; Tolerance: 0.5%; Voltage Rating: 50V; Length: 1mm; Height: 0.35mm; Width: 0.5mm; ComponentLink1URL: http://www.mouser.com/ds/2/219/RN73H-12200.pdf?src-supplier=Mouser; ComponentLink1Description: http://www.mouser.com/ds/2/219/RN73H-12200.pdf?src-supplier=Mouser
R77 R95 = Resistor: Manufacturer 1: Susumu; Manufacturer Part Number 1: RR0510P-102-D; Power Rating: 63mW; Tolerance: 0.5%; Voltage Rating: 25V; Temperature Coefficient: 25ppm/°C; Supplier 1: Digi-Key; Supplier Part Number 1: RR05P1.0KDCT-ND; Stock 1: 1157935; Pricing 1: 1=0.10000, 10=0.07400, 100=0.02850, 1000=0.01254, 2500=0.01083, 5000=0.00969 (USD); RoHS: Yes; Number of Pins: 2; Case Code (Metric): 1005; Case Code (Imperial): 0402; Min Operating Temperature: -55°C; Max Operating Temperature: 125°C; Package Quantity: 1; Resistance: 1kR; Packaging: Tape and Reel; Composition: Thin Film; Number of Terminations: 2; Termination: SMD/SMT; Max Power Dissipation: 63mW; Voltage Rating (DC): 25V; Length: 0.039inch; Height: 0.016inch; Width: 0.02inch; REACH SVHC: Unknown; Lead Free: Lead Free; ComponentLink1URL: https://datasheet.ciiva.com/2486/rr-data-sheet-2486776.pdf?src-supplier=Digi-Key; ComponentLink1Description: https://datasheet.ciiva.com/2486/rr-data-sheet-2486776.pdf?src-supplier=Digi-Key; ComponentLink2URL: https://datasheet.ciiva.com/2486/rr-data-sheet-2486777.pdf?src-supplier=Digi-Key; ComponentLink2Description: https://datasheet.ciiva.com/2486/rr-data-sheet-2486777.pdf?src-supplier=Digi-Key; ComponentLink3URL: https://datasheet.ciiva.com/2486/rr-data-sheet-2486778.pdf?src-supplier=Digi-Key; ComponentLink3Description: https://datasheet.ciiva.com/2486/rr-data-sheet-2486778.pdf?src-supplier=Digi-Key; ComponentLink4URL: https://datasheet.ciiva.com/7984/1581132-7984302.pdf?src-supplier=Element14; ComponentLink4Description: https://datasheet.ciiva.com/7984/1581132-7984302.pdf?src-supplier=Element14
R79 R83 R86 R89 = Resistor: Manufacturer 1: Vishay; Manufacturer Part Number 1: CRCW0402-10K0FKED; Tolerance: 1%; Power Rating: 63mW; Voltage Rating: 50V; Temperature Coefficient: 100ppm/°C; Supplier 1: Newark; Supplier Part Number 1: 52K6595; Stock 1: 0; RoHS: Yes; Mount: Surface Mount; Case/Package: 0402; Number of Pins: 2; Weight: 2.3E-05oz; Case Code (Metric): 1005; Case Code (Imperial): 0402; Contact Plating: Tin; Min Operating Temperature: -55°C; Max Operating Temperature: 155°C; Resistance: 10kR; Package Quantity: 10; Packaging: Tape and Reel; Termination: SMD/SMT; Military Standard: Not; Composition: Thick Film; Voltage Rating (DC): 50V; Number of Terminations: 2; Max Power Dissipation: 63mW; Features: Automotive AEC-Q200; Length: 1mm; Height: 0.35mm; Depth: 0.5mm; Width: 0.02inch; Radiation Hardening: No; REACH SVHC: Unknown; Lead Free: Lead Free; ComponentLink1URL: https://datasheet.ciiva.com/11809/0900766b80d98824-11809984.pdf?src-supplier=RSComponents; ComponentLink1Description: https://datasheet.ciiva.com/11809/0900766b80d98824-11809984.pdf?src-supplier=RSComponents; ComponentLink2URL: https://datasheet.ciiva.com/2463/dcrcwe3-2463025.pdf?src-supplier=Digi-Key; ComponentLink2Description: https://datasheet.ciiva.com/2463/dcrcwe3-2463025.pdf?src-supplier=Digi-Key; ComponentLink3URL: https://datasheet.ciiva.com/2463/dcrcwe3-2463026.pdf?src-supplier=Digi-Key; ComponentLink3Description: https://datasheet.ciiva.com/2463/dcrcwe3-2463026.pdf?src-supplier=Digi-Key; ComponentLink4URL: https://datasheet.ciiva.com/2463/dcrcwe3-2463027.pdf?src-supplier=Digi-Key; ComponentLink4Description: https://datasheet.ciiva.com/2463/dcrcwe3-2463027.pdf?src-supplier=Digi-Key; ComponentLink5URL: https://datasheet.ciiva.com/46385/1697337-46385560.pdf?src-supplier=Element14; ComponentLink5Description: https://datasheet.ciiva.com/46385/1697337-46385560.pdf?src-supplier=Element14; ComponentLink6URL: https://datasheet.ciiva.com/3255/dcrcwe3-3255961.pdf?src-supplier=Avnet; ComponentLink6Description: https://datasheet.ciiva.com/3255/dcrcwe3-3255961.pdf?src-supplier=Avnet; ComponentLink7URL: https://datasheet.ciiva.com/3255/dcrcwe3-3255962.pdf?src-supplier=Avnet; ComponentLink7Description: https://datasheet.ciiva.com/3255/dcrcwe3-3255962.pdf?src-supplier=Avnet; ComponentLink8URL: https://datasheet.ciiva.com/5547/dcrcwe3-109170-5547786.pdf?src-supplier=Mouser; ComponentLink8Description: https://datasheet.ciiva.com/5547/dcrcwe3-109170-5547786.pdf?src-supplier=Mouser; ComponentLink9URL: https://datasheet.ciiva.com/26316/fld-crcw-e3-data-en-26316618.pdf?src-supplier=Distrelec; ComponentLink9Description: https://datasheet.ciiva.com/26316/fld-crcw-e3-data-en-26316618.pdf?src-supplier=Distrelec; ComponentLink10URL: https://datasheet.ciiva.com/16208/dcrcwe3-16208525.pdf?src-supplier=Future+Electronics; ComponentLink10Description: https://datasheet.ciiva.com/16208/dcrcwe3-16208525.pdf?src-supplier=Future+Electronics; ComponentLink11URL: https://datasheet.ciiva.com/36856/1720486-36856909.pdf?src-supplier=Element14; ComponentLink11Description: https://datasheet.ciiva.com/36856/1720486-36856909.pdf?src-supplier=Element14
R80 = Resistor: RES 40.2K OHM 1% 1/16W 0402; Manufacturer: Stackpole Electronics; Manufacturer Part Number: RMCF0402FT40K2; Max Power Dissipation: 63mW; Temperature Coefficient: 100ppm/°C; Supplier 1: Digi-Key; Supplier Part Number 1: RMCF0402FT40K2CT-ND; RoHS: Yes; Category: Chip SMD Resistors; Stock 1: 48331; Pricing 1: 1=0,10000, 10=0,01400, 100=0,00580, 1000=0,00262, 2500=0,00228, 5000=0,00188 (USD); Mount: Surface Mount; Case/Package: 0402; Contact Plating: Tin,Matte; Case Code (Imperial): 0402; Case Code (Metric): 1005; Min Operating Temperature: -55°C; Max Operating Temperature: 155°C; Resistance: 40.2kR; Tolerance: 1%; Packaging: Tape and Reel; Composition: Thick Film; Number of Terminations: 2; Features: Automotive AEC-Q200; Length: 0.039inch; Height: 0.016inch; Width: 0.02inch; Radiation Hardening: No; Lead Free: Lead Free; ComponentLink1URL: https://www.seielect.com/catalog/SEI-Packaging.pdf?src-supplier=Digi-Key; ComponentLink1Description: https://www.seielect.com/catalog/SEI-Packaging.pdf?src-supplier=Digi-Key; ComponentLink2URL: https://www.seielect.com/catalog/SEI-RMCF_RMCP.pdf?src-supplier=Avnet; ComponentLink2Description: https://www.seielect.com/catalog/SEI-RMCF_RMCP.pdf?src-supplier=Avnet; ComponentLink3URL: http://components.arrow.com/part/dataview/50863704S9798453N1174?src-supplier=Arrow; ComponentLink3Description: http://components.arrow.com/part/dataview/50863704S9798453N1174?src-supplier=Arrow
R88 = Resistor: RES SMD 35K OHM 0.1% 1/20W 0402; Manufacturer: Vishay Dale; Manufacturer Part Number: PNM0402E3502BST1; Max Power Dissipation: 50mW; Temperature Coefficient: 25ppm/°C; Supplier 1: Digi-Key; Supplier Part Number 1: 541-1904-1-ND; RoHS: Yes; Category: Chip SMD Resistors; Stock 1: 10611; Pricing 1: 1=1,08000, 10=0,95500, 100=0,69300 (USD); Case Code (Imperial): 0402; Case Code (Metric): 1005; Min Operating Temperature: -55°C; Max Operating Temperature: 155°C; Number of Terminations: 2; Composition: Thin Film; Package Quantity: 1000; Packaging: Tape and Reel; Resistance: 35kR; Tolerance: 0.1%; Features: Moisture Resistant,Anti-Sulfur; Length: 0.042inch; Height: 0.033inch; Width: 0.022inch; ComponentLink1URL: https://datasheet.ciiva.com/29717/pnm-29717422.pdf?src-supplier=Digi-Key; ComponentLink1Description: https://datasheet.ciiva.com/29717/pnm-29717422.pdf?src-supplier=Digi-Key; ComponentLink2URL: https://datasheet.ciiva.com/29717/pnm-29717423.pdf?src-supplier=Digi-Key; ComponentLink2Description: https://datasheet.ciiva.com/29717/pnm-29717423.pdf?src-supplier=Digi-Key
R90 = Resistor: Manufacturer 1: Susumu; Manufacturer Part Number 1: RR0510P-1822-D; Power Rating: 62.5mW; Tolerance: 0.5%; Voltage Rating: 25V; Max Power Dissipation: 63mW; Temperature Coefficient: 25ppm/°C; Voltage Rating (DC): 50V; Supplier 1: Digi-Key; Supplier Part Number 1: RR05P18.2KDCT-ND; Stock 1: 48500; Pricing 1: 1=0.10000, 10=0.07400, 100=0.02850, 1000=0.01254, 2500=0.01083, 5000=0.00969 (USD); RoHS: Yes; Case/Package: 0402; Case Code (Metric): 1005; Case Code (Imperial): 0402; Min Operating Temperature: -55°C; Max Operating Temperature: 125°C; Package Quantity: 1; Resistance: 18.2kR; Packaging: Tape and Reel; Composition: Thin Film; Number of Terminations: 2; Termination: SMD/SMT; Length: 0.039inch; Height: 0.016inch; Width: 0.02inch; Lead Free: Lead Free; ComponentLink1URL: https://datasheet.ciiva.com/2494/rr-data-sheet-2494006.pdf?src-supplier=Digi-Key; ComponentLink1Description: https://datasheet.ciiva.com/2494/rr-data-sheet-2494006.pdf?src-supplier=Digi-Key; ComponentLink2URL: https://datasheet.ciiva.com/2494/rr-data-sheet-2494007.pdf?src-supplier=Digi-Key; ComponentLink2Description: https://datasheet.ciiva.com/2494/rr-data-sheet-2494007.pdf?src-supplier=Digi-Key; ComponentLink3URL: https://datasheet.ciiva.com/2494/rr-data-sheet-2494008.pdf?src-supplier=Digi-Key; ComponentLink3Description: https://datasheet.ciiva.com/2494/rr-data-sheet-2494008.pdf?src-supplier=Digi-Key
R91 = Resistor: Manufacturer 1: Panasonic; Manufacturer Part Number 1: ERA-2AEB6192X; Voltage Rating: 25V; Power Rating: 63mW; Tolerance: 0.1%; Temperature Coefficient: 25ppm/°C; Voltage Rating (DC): 50V; Supplier 1: Digi-Key; Supplier Part Number 1: P61.9KDCCT-ND; Stock 1: 12743; Pricing 1: 1=0.45000, 10=0.32100, 100=0.12830, 1000=0.06322, 2500=0.05858, 5000=0.05300 (USD); RoHS: Yes; Mount: Surface Mount; Case/Package: 0402; Case Code (Metric): 1005; Case Code (Imperial): 0402; Contact Plating: Tin; Min Operating Temperature: -55°C; Max Operating Temperature: 155°C; Packaging: Tape and Reel; Package Quantity: 1; Resistance: 61.9kR; Composition: Thin Film,Metal Film; Number of Terminations: 2; Termination: SMD/SMT; Max Power Dissipation: 63mW; Features: Automotive AEC-Q200; Length: 0.039inch; Height: 0.016inch; Width: 0.02inch; Radiation Hardening: No; REACH SVHC: Unknown; Lead Free: Lead Free; ComponentLink1URL: https://datasheet.ciiva.com/24058/aoa0000ce26-32660-24058744.pdf?src-supplier=Mouser; ComponentLink1Description: https://datasheet.ciiva.com/24058/aoa0000ce26-32660-24058744.pdf?src-supplier=Mouser
R92 = Resistor: Manufacturer 1: Panasonic; Manufacturer Part Number 1: ERA-2AEB1052X; Power Rating: 63mW; Tolerance: 0.1%; Voltage Rating: 25V; Temperature Coefficient: 25ppm/°C; Voltage Rating (DC): 50V; Supplier 1: Digi-Key; Supplier Part Number 1: P10.5KDCCT-ND; Stock 1: 29203; Pricing 1: 1=0.45000, 10=0.32100, 100=0.12830, 1000=0.06322, 2500=0.05858, 5000=0.05300 (USD); RoHS: Yes; Mount: Surface Mount; Case/Package: 0402; Case Code (Metric): 1005; Case Code (Imperial): 0402; Min Operating Temperature: -55°C; Max Operating Temperature: 155°C; Packaging: Tape and Reel; Resistance: 10.5kR; Package Quantity: 1; Composition: Metal Film,Thin Film; Number of Terminations: 2; Max Power Dissipation: 63mW; Features: Automotive AEC-Q200; Termination: SMD/SMT; Length: 0.039inch; Height: 0.016inch; Width: 0.5mm; Lead Free: Lead Free; ComponentLink1URL: http://www.mouser.com/ds/2/315/AOA0000CE26-32660.pdf?src-supplier=Mouser; ComponentLink1Description: http://www.mouser.com/ds/2/315/AOA0000CE26-32660.pdf?src-supplier=Mouser; ComponentLink2URL: https://media.digikey.com/pdf/Data%20Sheets/Panasonic%20Resistors%20Thermistors%20PDFs/ERA_Series_LE.pdf?src-supplier=Digi-Key; ComponentLink2Description: https://media.digikey.com/pdf/Data%20Sheets/Panasonic%20Resistors%20Thermistors%20PDFs/ERA_Series_LE.pdf?src-supplier=Digi-Key; ComponentLink3URL: http://www.onlinecomponents.com/datasheet/era-2aeb1052x.aspx?p=44473930&src-supplier=Onlinecomponents.com; ComponentLink3Description: http://www.onlinecomponents.com/datasheet/era-2aeb1052x.aspx?p=44473930&src-supplier=Onlinecomponents.com; ComponentLink4URL: http://www.farnell.com/datasheets/2052875.pdf?src-supplier=Newark; ComponentLink4Description: http://www.farnell.com/datasheets/2052875.pdf?src-supplier=Newark; ComponentLink5URL: https://industrial.panasonic.com/cdbs/www-data/pdf/RDM0000/AOA0000C307.pdf?src-supplier=Digi-Key; ComponentLink5Description: https://industrial.panasonic.com/cdbs/www-data/pdf/RDM0000/AOA0000C307.pdf?src-supplier=Digi-Key
R93 = Resistor: Manufacturer 1: Susumu; Manufacturer Part Number 1: RR0510P-4021-D; Power Rating: 62.5mW; Tolerance: 0.5%; Voltage Rating: 25V; Temperature Coefficient: 25ppm/°C; Max Power Dissipation: 63mW; Voltage Rating (DC): 50V; Supplier 1: Digi-Key; Supplier Part Number 1: RR05P4.02KDCT-ND; Stock 1: 40212; Pricing 1: 1=0.10000, 10=0.07400, 100=0.02850, 1000=0.01254, 2500=0.01083, 5000=0.00969 (USD); RoHS: Yes; Case Code (Metric): 1005; Case Code (Imperial): 0402; Min Operating Temperature: -55°C; Max Operating Temperature: 125°C; Package Quantity: 10000; Resistance: 4.02kR; Packaging: Tape and Reel; Composition: Thin Film; Number of Terminations: 2; Termination: SMD/SMT; Length: 0.039inch; Height: 0.016inch; Width: 0.02inch; Lead Free: Lead Free; ComponentLink1URL: https://datasheet.ciiva.com/2494/rr-data-sheet-2494048.pdf?src-supplier=Digi-Key; ComponentLink1Description: https://datasheet.ciiva.com/2494/rr-data-sheet-2494048.pdf?src-supplier=Digi-Key; ComponentLink2URL: https://datasheet.ciiva.com/2494/rr-data-sheet-2494049.pdf?src-supplier=Digi-Key; ComponentLink2Description: https://datasheet.ciiva.com/2494/rr-data-sheet-2494049.pdf?src-supplier=Digi-Key; ComponentLink3URL: https://datasheet.ciiva.com/2494/rr-data-sheet-2494050.pdf?src-supplier=Digi-Key; ComponentLink3Description: https://datasheet.ciiva.com/2494/rr-data-sheet-2494050.pdf?src-supplier=Digi-Key
R94 = Resistor: Manufacturer 1: Vishay; Manufacturer Part Number 1: CRCW0402120RFKED; Tolerance: 1%; Voltage Rating: 50V; Temperature Coefficient: 100ppm/°C; Power Rating: 63mW; Supplier 1: Digi-Key; Supplier Part Number 1: 541-120LCT-ND; Stock 1: 158664; Pricing 1: 1=0,10000, 10=0,03800, 100=0,01540, 1000=0,00690, 2500=0,00599, 5000=0,00495 (USD); RoHS: Yes; Mount: Surface Mount; Case/Package: 0402; Weight: 2.3E-05oz; Case Code (Metric): 1005; Case Code (Imperial): 0402; Contact Plating: Tin; Min Operating Temperature: -55°C; Max Operating Temperature: 155°C; Packaging: Tape and Reel; Package Quantity: 10000; Termination: SMD/SMT; Composition: Thick Film; Resistance: 120R; Voltage Rating (DC): 50V; Military Standard: Not; Number of Terminations: 2; Max Power Dissipation: 63mW; Features: Automotive AEC-Q200; Working Voltage: 50V; Length: 1mm; Height: 0.35mm; Width: 0.02inch; Depth: 0.5mm; Radiation Hardening: No; REACH SVHC: Unknown; Lead Free: Lead Free; ComponentLink1URL: https://datasheet.ciiva.com/11817/0900766b80d98824-11817989.pdf?src-supplier=RSComponents; ComponentLink1Description: https://datasheet.ciiva.com/11817/0900766b80d98824-11817989.pdf?src-supplier=RSComponents; ComponentLink2URL: https://datasheet.ciiva.com/2463/dcrcwe3-2463109.pdf?src-supplier=Digi-Key; ComponentLink2Description: https://datasheet.ciiva.com/2463/dcrcwe3-2463109.pdf?src-supplier=Digi-Key; ComponentLink3URL: https://datasheet.ciiva.com/8336/dcrcwe3-8336661.pdf?src-supplier=Avnet; ComponentLink3Description: https://datasheet.ciiva.com/8336/dcrcwe3-8336661.pdf?src-supplier=Avnet; ComponentLink4URL: https://datasheet.ciiva.com/2463/dcrcwe3-2463110.pdf?src-supplier=Digi-Key; ComponentLink4Description: https://datasheet.ciiva.com/2463/dcrcwe3-2463110.pdf?src-supplier=Digi-Key; ComponentLink5URL: https://datasheet.ciiva.com/5550/dcrcwe3-109170-5550502.pdf?src-supplier=Mouser; ComponentLink5Description: https://datasheet.ciiva.com/5550/dcrcwe3-109170-5550502.pdf?src-supplier=Mouser; ComponentLink6URL: https://datasheet.ciiva.com/2463/dcrcwe3-2463111.pdf?src-supplier=Digi-Key; ComponentLink6Description: https://datasheet.ciiva.com/2463/dcrcwe3-2463111.pdf?src-supplier=Digi-Key; ComponentLink7URL: https://datasheet.ciiva.com/3256/dcrcwe3-3256009.pdf?src-supplier=Avnet; ComponentLink7Description: https://datasheet.ciiva.com/3256/dcrcwe3-3256009.pdf?src-supplier=Avnet; ComponentLink8URL: https://datasheet.ciiva.com/7777/1697337-7777194.pdf?src-supplier=Element14; ComponentLink8Description: https://datasheet.ciiva.com/7777/1697337-7777194.pdf?src-supplier=Element14; ComponentLink9URL: https://datasheet.ciiva.com/7777/1697337-7777195.pdf?src-supplier=Element14; ComponentLink9Description: https://datasheet.ciiva.com/7777/1697337-7777195.pdf?src-supplier=Element14; ComponentLink10URL: https://datasheet.ciiva.com/16881/dcrcwe3-16881548.pdf?src-supplier=Avnet+Europe; ComponentLink10Description: https://datasheet.ciiva.com/16881/dcrcwe3-16881548.pdf?src-supplier=Avnet+Europe; ComponentLink11URL: https://datasheet.ciiva.com/16199/dcrcwe3-16199070.pdf?src-supplier=Future+Electronics; ComponentLink11Description: https://datasheet.ciiva.com/16199/dcrcwe3-16199070.pdf?src-supplier=Future+Electronics; ComponentLink12URL: https://datasheet.ciiva.com/22674/1912744-22674687.pdf?src-supplier=Element14; ComponentLink12Description: https://datasheet.ciiva.com/22674/1912744-22674687.pdf?src-supplier=Element14
R117 = Resistor: RES SMD 4.64K OHM 1% 1/16W 0402; Manufacturer: Stackpole Electronics; Manufacturer Part Number: RMCF0402FT4K64; Max Power Dissipation: 63mW; Temperature Coefficient: 100ppm/°C; Supplier 1: Digi-Key; Supplier Part Number 1: RMCF0402FT4K64CT-ND; RoHS: Yes; Category: Chip SMD Resistors; Stock 1: 48574; Pricing 1: 1=0,10000, 10=0,01400, 100=0,00580, 1000=0,00262, 2500=0,00228, 5000=0,00188 (USD); Mount: Surface Mount; Case Code (Imperial): 0402; Contact Plating: Tin,Matte; Case Code (Metric): 1005; Min Operating Temperature: -55°C; Max Operating Temperature: 155°C; Packaging: Tape and Reel; Resistance: 4.64kR; Tolerance: 1%; Features: Automotive AEC-Q200; Composition: Thick Film; Number of Terminations: 2; Length: 0.039inch; Height: 0.016inch; Width: 0.02inch; Radiation Hardening: No; Lead Free: Lead Free; ComponentLink1URL: https://www.seielect.com/Catalog/SEI-RMCF_RMCP.pdf?src-supplier=Digi-Key; ComponentLink1Description: https://www.seielect.com/Catalog/SEI-RMCF_RMCP.pdf?src-supplier=Digi-Key; ComponentLink2URL: https://www.seielect.com/catalog/SEI-Packaging.pdf?src-supplier=Digi-Key; ComponentLink2Description: https://www.seielect.com/catalog/SEI-Packaging.pdf?src-supplier=Digi-Key; ComponentLink3URL: https://www.seielect.com/catalog/SEI-RMCF_RMCP.pdf?src-supplier=Avnet; ComponentLink3Description: https://www.seielect.com/catalog/SEI-RMCF_RMCP.pdf?src-supplier=Avnet
R118 = Resistor: YAGEO - RC0402FR-072RL - SMD Chip Resistor, 0402 [1005 Metric], 2 ohm, RC Series, 50 V, Thick Film, 63 mW; Power Rating: 63mW; Tolerance: 1%; Voltage Rating: 50V; Temperature Coefficient: 200ppm/°C; Supplier 1: Digi-Key; Supplier Part Number 1: YAG3369CT-ND; Manufacturer: Yageo; Manufacturer Part Number: RC0402FR-072RL; RoHS: Yes; Category: Chip SMD Resistors; Stock 1: 248279; Pricing 1: 1=0,10000, 10=0,02400, 100=0,00970, 1000=0,00435, 2500=0,00377, 5000=0,00312 (USD); Contact Plating: Tin,Matte; Case Code (Imperial): 0402; Case Code (Metric): 1005; Min Operating Temperature: -55°C; Max Operating Temperature: 155°C; Resistance: 2R; Features: Moisture Resistant; Packaging: Tape and Reel; Max Power Dissipation: 63mW; Voltage Rating (DC): 50V; Termination: SMD/SMT; Number of Terminations: 2; Military Standard: Not; Composition: Thick Film; Length: 1mm; Height: 0.016inch; Width: 0.02inch; Depth: 0.5mm; REACH SVHC: Unknown; Lead Free: Lead Free; ComponentLink1URL: https://datasheet.ciiva.com/11808/0900766b80c66297-11808785.pdf?src-supplier=RSComponents; ComponentLink1Description: https://datasheet.ciiva.com/11808/0900766b80c66297-11808785.pdf?src-supplier=RSComponents; ComponentLink2URL: https://datasheet.ciiva.com/16868/pyu-rc0402-51-rohs-l-6-16868438.pdf?src-supplier=Avnet+Europe; ComponentLink2Description: https://datasheet.ciiva.com/16868/pyu-rc0402-51-rohs-l-6-16868438.pdf?src-supplier=Avnet+Europe; ComponentLink3URL: https://datasheet.ciiva.com/5596/pyu-rc0402-51-rohs-l-6-r-5596055.pdf?src-supplier=Mouser; ComponentLink3Description: https://datasheet.ciiva.com/5596/pyu-rc0402-51-rohs-l-6-r-5596055.pdf?src-supplier=Mouser; ComponentLink4URL: https://datasheet.ciiva.com/28415/pyu-rc0402-51-rohs-l-6-28415608.pdf?src-supplier=Avnet+Europe; ComponentLink4Description: https://datasheet.ciiva.com/28415/pyu-rc0402-51-rohs-l-6-28415608.pdf?src-supplier=Avnet+Europe; ComponentLink5URL: https://datasheet.ciiva.com/8894/pyu-rc0402-51-rohs-l-6-8894730.pdf?src-supplier=Avnet; ComponentLink5Description: https://datasheet.ciiva.com/8894/pyu-rc0402-51-rohs-l-6-8894730.pdf?src-supplier=Avnet; ComponentLink6URL: https://datasheet.ciiva.com/7849/1018594-7849950.pdf?src-supplier=Element14; ComponentLink6Description: https://datasheet.ciiva.com/7849/1018594-7849950.pdf?src-supplier=Element14; ComponentLink7URL: https://datasheet.ciiva.com/7849/1018594-7849951.pdf?src-supplier=Element14; ComponentLink7Description: https://datasheet.ciiva.com/7849/1018594-7849951.pdf?src-supplier=Element14